# Altium schematic sheet POWER.SchDoc
size A4; SheetNumber: 5; SheetTotal: 8
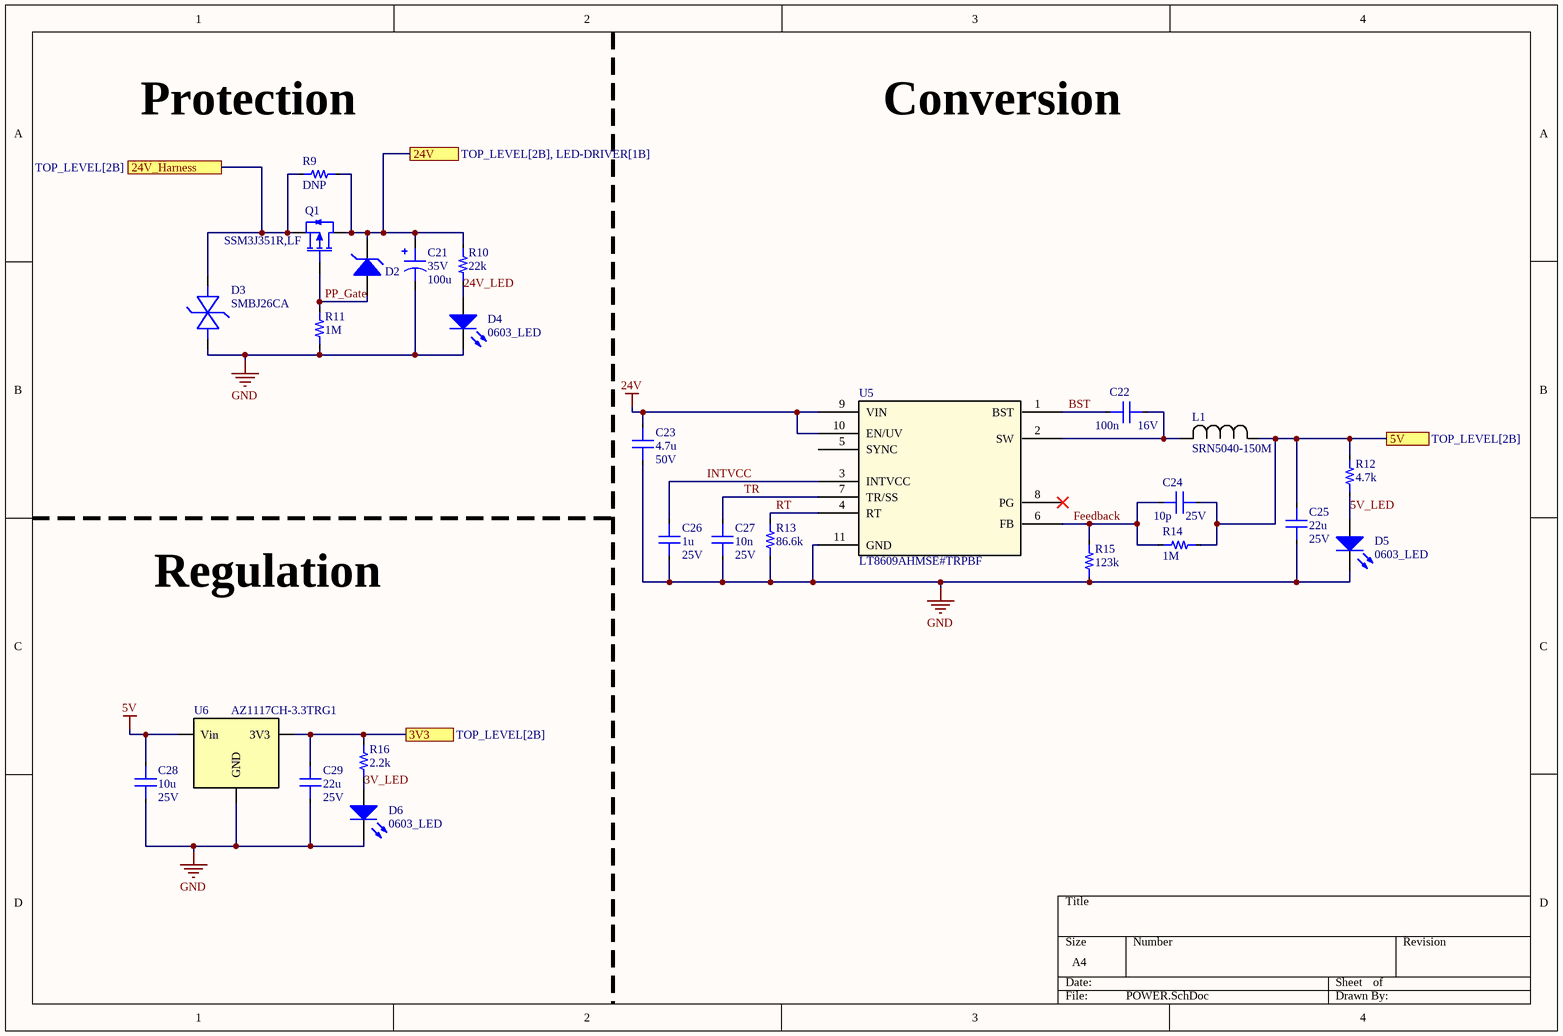
[diagram p0: POWER.SchDoc]

## Parts
C21  Voltage: 35V  Vaule: 100u  [6.60x6.60x8.00mm_E_CAP]  (hidden comment: 865080545012)
C22  value 100n  Voltage: 16V  [0603_CAP]  (hidden comment: Capacitor)
C23  value 4.7u  Voltage: 50V  [1206_CAP]  (hidden comment: Capacitor)
C24  value 10p  Voltage: 25V  [0603_CAP]  (hidden comment: Capacitor)
C25  value 22u  Voltage: 25V  [1206_CAP]  (hidden comment: Capacitor)
C26  value 1u  Voltage: 25V  [0603_CAP]  (hidden comment: Capacitor)
C27  value 10n  Voltage: 25V  [0603_CAP]  (hidden comment: Capacitor)
C28  value 10u  Voltage: 25V  [0603_CAP]  (hidden comment: Capacitor)
C29  value 22u  Voltage: 25V  [0603_CAP]  (hidden comment: Capacitor)
D2  MMSZ5231B-7-F  [SOD-123]  (value not drawn)
D3  SMBJ26CA  [SMBJ26CA]
D4  0603_LED  [0603_LED]
D5  0603_LED  [0603_LED]
D6  0603_LED  [0603_LED]
L1  SRN5040-150M  [SRN5040-150M]
Q1  SSM3J351R,LF  [SSM3J351R,LF]
R9  value DNP  [0603_RES]  (hidden comment: Resistor)
R10  value 22k  [0603_RES]  (hidden comment: Resistor)
R11  value 1M  [0603_RES]  (hidden comment: Resistor)
R12  value 4.7k  [0603_RES]  (hidden comment: Resistor)
R13  value 86.6k  [0603_RES]  (hidden comment: Resistor)
R14  value 1M  [0603_RES]  (hidden comment: Resistor)
R15  value 123k  [0603_RES]  (hidden comment: Resistor)
R16  value 2.2k  [0603_RES]  (hidden comment: Resistor)
U5  LT8609AHMSE#TRPBF  [05-08-1664_ADI]
U6  AZ1117CH-3.3TRG1  [SOT-233-4]

## Ports
3V3 (see TOP_LEVEL[2B]), 5V (see TOP_LEVEL[2B]), 24V (see TOP_LEVEL[2B], LED-DRIVER[1B]), 24V_Harness (see TOP_LEVEL[2B])

## Nets
5V: C28.2 U6.3(Vin)
24V: C23.2 U5.9(VIN) U5.10(EN/UV)
GND: C21.2 C23.1 C25.1 C26.1 C27.1 C28.1 C29.1 D3.1 D4.1(C) D5.1(C) D6.1(C) R11.1 R13.1 R15.2 U5.11(GND) U6.1(GND)
3V3: C29.2 R16.2 U6.2,_4(3V3) ; port 3V3
3V_LED: D6.2(A) R16.1
5V: C24.2 C25.2 L1.2 R12.2 R14.1 ; port 5V  [a separate net that carries the same name]
5V_LED: D5.2(A) R12.1
24V: C21.1 D2.1(K) Q1.3(D) R9.2 R10.2 ; port 24V  [a separate net that carries the same name]
24V_Harness: D3.2 Q1.2(S) R9.1 ; port 24V_Harness
24V_LED: D4.2(A) R10.1
BST: C22.2 U5.1(BST)
Feedback: C24.1 R14.2 R15.1 U5.6(FB)
INTVCC: C26.2 U5.3(INTVCC)
PP_Gate: D2.2(A) Q1.1(G) R11.2
RT: R13.2 U5.4(RT)
TR: C27.2 U5.7(TR/SS)
NetC22_1: C22.1 L1.1 U5.2(SW)

Not connected (* = marked no-connect by the designer): U5 5(SYNC) 8(PG)*

## Notes on the sheet
- (near R9) Protection
- Conversion
- Regulation

## Library data of the parts
C21 = 865080545012: CAP ALUM 100UF 20% 35V SMD; ComponentLink1Description: Digikey; ComponentLink1URL: https://www.digikey.com/en/products/detail/würth-elektronik/865080545012/5728106
D2 = MMSZ5231B-7-F: Zener Diode 5.1V 500mW ±5% Surface Mount SOD-123; Num_Circuits: 1; Package: SOD-123; ComponentLink1Description: Digikey; ComponentLink1URL: https://www.digikey.com/en/products/detail/diodes-incorporated/MMSZ5231B-7-F/755472
D3 = SMBJ26CA: 42.1V Clamp 14.3A Ipp Tvs Diode Surface Mount DO-214AA (SMBJ); ComponentLink1Description: Digikey; ComponentLink1URL: https://www.digikey.com/en/products/detail/littelfuse-inc/SMBJ26CA/286000
D4-D6 = 0603_LED: WL-SMCW Mono-color Chip LED Waterclear, SMT, size 0603, Blue, 3.2V, 140°; Manufacturer Part Number: 150060BS75000; Manufacturer: Wurth Elektronik; Case/Size Code: 0603; Chip Technology: InGaN; Dominant Wavelength: 470nm; Luminous Intensity: 145mcd; Peak Wavelength: 465nm; Category: Signal LEDs; Match Code: WL-SMCW; ComponentLink1Description: Website Link; ComponentLink1URL: https://www.we-online.com/redexpert/article/150060BS75000?ad; ComponentLink2Description: Datasheet Link; ComponentLink2URL: https://www.we-online.com/redexpert/spec/150060BS75000?ad; Mount: Surface Mount; Operating Temperature Max: 85°C; Operating Temperature Min: -40°C; Packaging: Tape and Reel; Length: 1.6mm; Width: 0.8mm; Height: 0.7mm; Emitting Color: Blue; Forward Voltage: 3.2V; Viewing Angle: 140°
L1 = SRN5040-150M: FIXED IND 15UH 1.8A 96 MOHM SMD
Q1 = SSM3J351R,LF: MOSFET P-CH 60V 3.5A SOT-23F
U5 = LT8609AHMSETRPBF: Buck Switching Regulator IC Positive Adjustable 0.782V 1 Output 3A 10-TFSOP, 10-MSOP (0.118", 3.00mm Width) Exposed Pad; Manufacturer_Name: Analog Devices Inc; Type: Power Management; Copyright: Copyright (C) 2025 Ultra Librarian. All rights reserved.; Manufacturer_Part_Number: LT8609AHMSE#TRPBF; RefDes: RefDes
U6 = AZ1117CH-3.3TRG1: No Description Available; Manufacturer_Name: Diodes Inc; Copyright: Copyright (C) 2025 Ultra Librarian. All rights reserved.; Manufacturer_Part_Number: AZ1117CH-3.3TRG1; RefDes: RefDes; Type: Type
C22-C29 = Capacitor: Dielectric: *; Percent Tolerance: *; ESR: *
R9-R16 = Resistor: Tolerance: *